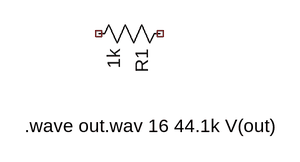
[diagram p0: schematic wave.asc]
wave.asc, the LTspice schematic file:
Version 4.1
SHEET 1 880 680
SYMBOL res 192 0 R90
SYMATTR InstName R1
SYMATTR Value 1k
TEXT 0 136 Left 2 !.wave out.wav 16 44.1k V(out)

The netlist it stands for:
* wave.asc
R1 NC_01 NC_02 1k
.wave out.wav 16 44.1k V(out)
.backanno
.end